# Altium schematic sheet attenuation_stage.SchDoc
size A4; CompanyName: MCI Management Center Innsbruck; Address1: Universitätsstraße 15; Address2: A-6020 Innsbruck
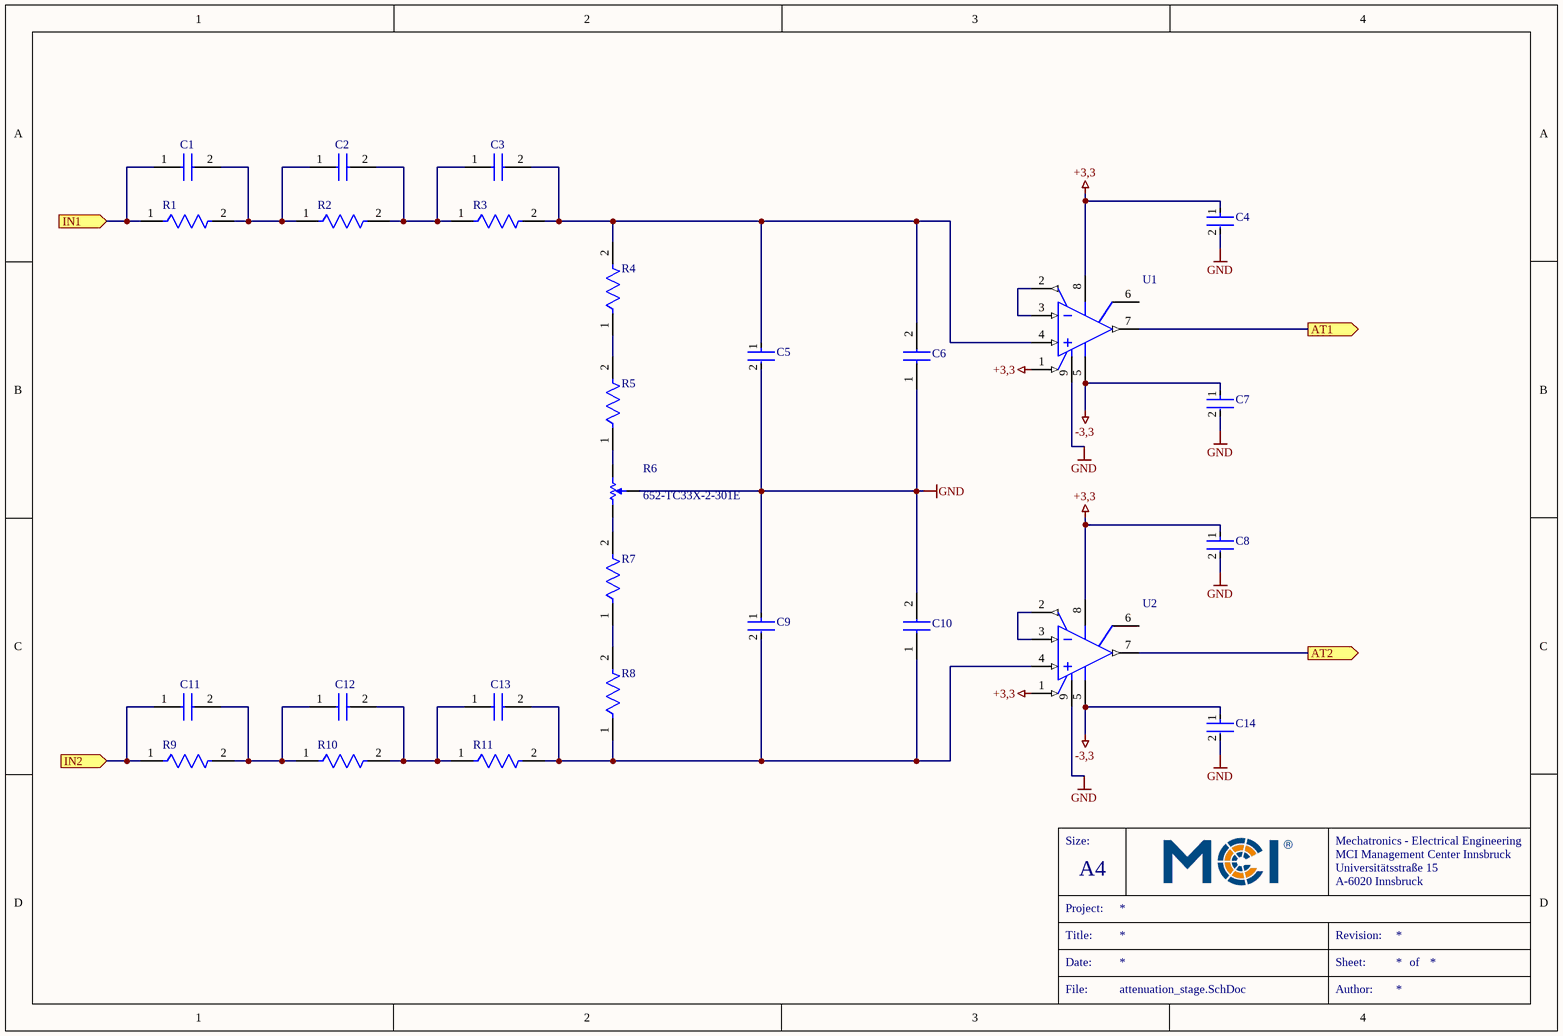
[diagram p0: attenuation_stage.SchDoc]

## Parts
C1  C0402C100C5GACAUTO  [CAPC1005X65N]  (value not drawn)
C2  C0402C100C5GACAUTO  [CAPC1005X65N]  (value not drawn)
C3  C0402C100C5GACAUTO  [CAPC1005X65N]  (value not drawn)
C4  CGA2B3X7R1E104K050BB  [FP-CGA2B-IPC_B]  (value not drawn)
C5  GRT1555C1H511FA02D  [FP-GRT155-0_05-IPC_A]  (value not drawn)
C6  JR200  [CAPM3531X35N]  (value not drawn)
C7  CGA2B3X7R1E104K050BB  [FP-CGA2B-IPC_B]  (value not drawn)
C8  CGA2B3X7R1E104K050BB  [FP-CGA2B-IPC_B]  (value not drawn)
C9  GRT1555C1H511FA02D  [FP-GRT155-0_05-IPC_A]  (value not drawn)
C10  JR200  [CAPM3531X35N]  (value not drawn)
C11  C0402C100C5GACAUTO  [CAPC1005X65N]  (value not drawn)
C12  C0402C100C5GACAUTO  [CAPC1005X65N]  (value not drawn)
C13  C0402C100C5GACAUTO  [CAPC1005X65N]  (value not drawn)
C14  CGA2B3X7R1E104K050BB  [FP-CGA2B-IPC_B]  (value not drawn)
R1  ERA-3AEB334V  [FP-ERA3A-MFG]  (value not drawn)
R2  ERA-3AEB334V  [FP-ERA3A-MFG]  (value not drawn)
R3  ERA-3AEB334V  [FP-ERA3A-MFG]  (value not drawn)
R4  RT0603BRD076K49L  [FP-RT0603-MFG]  (value not drawn)
R5  RT0603BRD0721R5L  [FP-RT0603-MFG]  (value not drawn)
R6  Mouser Part Number: 652-TC33X-2-301E  [BOUR-TC33X-2_V]  (hidden comment: TC33X-2-103E)
R7  RT0603BRD0721R5L  [FP-RT0603-MFG]  (value not drawn)
R8  RT0603BRD076K49L  [FP-RT0603-MFG]  (value not drawn)
R9  ERA-3AEB334V  [FP-ERA3A-MFG]  (value not drawn)
R10  ERA-3AEB334V  [FP-ERA3A-MFG]  (value not drawn)
R11  ERA-3AEB334V  [FP-ERA3A-MFG]  (value not drawn)
U1  ADA4817-1ACPZ-R7  [ADI-CP-8-2_L]  (value not drawn)
U2  ADA4817-1ACPZ-R7  [ADI-CP-8-2_L]  (value not drawn)

## Ports
AT1 (out), AT2 (out), IN1 (in), IN2 (in)

## Nets
+3,3: C4.1 C8.1 U1.1(~{PD}) U1.8(+VS) U2.1(~{PD}) U2.8(+VS)
-3,3: C7.1 C14.1 U1.5(-VS) U2.5(-VS)
GND: C4.2 C5.2 C6.1 C7.2 C8.2 C9.1 C10.2 C14.2 R6.2 U1.9(EP) U2.9(EP)
AT1: U1.7(OUT) ; port AT1
AT2: U2.7(OUT) ; port AT2
IN1: C1.1 R1.1 ; port IN1
IN2: C11.1 R9.1 ; port IN2
NetC1_2: C1.2 C2.1 R1.2 R2.1
NetC2_2: C2.2 C3.1 R2.2 R3.1
NetC3_2: C3.2 C5.1 C6.2 R3.2 R4.2 U1.4(+IN)
NetC9_2: C9.2 C10.1 C13.2 R8.1 R11.2 U2.4(+IN)
NetC11_2: C11.2 C12.1 R9.2 R10.1
NetC12_2: C12.2 C13.1 R10.2 R11.1
NetR4_1: R4.1 R5.2
NetR5_1: R5.1 R6.3
NetR6_1: R6.1 R7.2
NetR7_1: R7.1 R8.2
NetU1_2: U1.2(FB) U1.3(-IN)
NetU2_2: U2.2(FB) U2.3(-IN)

Not connected (* = marked no-connect by the designer): U1 6(NC); U2 6(NC)

## Notes on the sheet
- Size:
- Mechatronics - Electrical Engineering
- Project:
- A4
- Title:
- Date:
- Revision:
- Sheet:
- of
- File:
- Author:

## Library data of the parts
C1-C3 C11-C13 = C0402C100C5GACAUTO: Capacitor; Manufacturer_Name: Yageo Group; Datasheet Link: https://www.arrow.com/en/products/c0402c100c5gacauto/kemet-corporation?region=nac; Height: 0.65mm; Manufacturer_Part_Number: C0402C100C5GACAUTO; Mouser Part Number: 80-C0402C100C5GAUTO; Mouser Price/Stock: https://www.mouser.co.uk/ProductDetail/KEMET/C0402C100C5GACAUTO?qs=jI8Gez59nxIdSgXSmqmKxg%3D%3D; Arrow Part Number: C0402C100C5GACAUTO; Arrow Price/Stock: https://www.arrow.com/en/products/c0402c100c5gacauto/kemet-corporation?region=nac
C4 C7 C8 C14 = CMP-2000-06086-2: Cap Ceramic 100nF 25V X7R 10% Pad SMD 0402 +125°C Automotive T/R; Lead Free: Lead Free; Termination: SMD/SMT; Voltage Rating: 25V; Voltage: 25V; Composition: Ceramic; Case/Package: 0402; Mount: Surface Mount; Voltage Rating (DC): 25V; Tolerance: 10%; Length: 1mm; Width: 0.02inch; REACH SVHC: No SVHC; Max Operating Temperature: 125°C; Case Code (Metric): 1005; Case Code (Imperial): 0402; Package Quantity: 1; Depth: 0.5mm; Min Operating Temperature: -55°C; Thickness: 0.022inch; Capacitance: 100nF; Height: 0.5mm; Dielectric: X7R; Packaging: Tape and Reel; Weight: 2.3E-05oz; Ratings: AEC-Q200
C5 C9 = CMP-06035-032859-1: Multi-Layer Ceramic Capacitor 510pF 50V C0G ±1% 0402 Paper T/R
C6 C10 = JR200: Capacitor; Manufacturer_Name: Knowles; Datasheet Link: https://datasheet.datasheetarchive.com/originals/distributors/DKDS-39/7593.pdf; Height: 0.35mm; Manufacturer_Part_Number: JR200; Mouser Part Number: 768-JR200; Mouser Price/Stock: https://www.mouser.co.uk/ProductDetail/Knowles-Voltronics/JR200?qs=Xqu1B%2Fs4UobrJFNnt%2FmsIw%3D%3D
R1-R3 R9-R11 = CMP-2000-00042-2: NexarPartId: 1240193; Max Power Dissipation: 100mW; Temperature Coefficient: 25ppm/°C; Voltage Rating (DC): 75V; Resistance: 330kΩ; Tolerance: 0.1%; Depth: 800µm; Composition: Metal Film, Thin Film; Termination: SMD/SMT; RoHS: Compliant; Case Code (Metric): 1608; Length: 1.6mm; Features: Automotive AEC-Q200; Number of Terminations: 2; Military Standard: Not; Min Operating Temperature: -55°C; Power Rating: 100mW; REACH SVHC: No SVHC; Mount: Surface Mount; Voltage Rating: 75V; Lifecycle Status: Production; Case/Package: 0603; Case Code (Imperial): 0603; Schedule B: 8533210045, 8533210045; Lead Free: Lead Free; Packaging: Tape & Reel; Radiation Hardening: No; Contact Plating: Tin; Height: 450µm; Max Operating Temperature: 155°C; Width: 800µm; Number of Pins: 2
R4 R8 = CMP-2000-04494-2: RES 6.49K OHM 1/10W .1% SMD 0603; Manufacturer: Yageo; Temperature Coefficient: 25 ppm/°C; Tolerance: 0.001; Value: 6.49KΩ; Power Rating: 0.1W; Voltage Rating: 75V; Device Class L3: Chip SMD Resistors; Mouser Description: Thin Film Resistors - SMD 1/10W 6.49K ohm .1% 25ppm; Ipc Land Pattern Name: RESC16080X45; ComponentLink2URL: http://www.yageo.com/documents/recent/PYu-RT_1-to-0.01_RoHS_L_9.pdf; Device Class L1: Passive Components; Footprint Url: http://www.yageo.com/exep/pages/download/literatures/PYu-R_Mount_10.pdf; Category: Res; Device Class L2: Resistors; Temperature: -55°C to +155°C; Automotive: No; Digikey Description: RES 6.49K OHM 1/10W .1% SMD 0603; Temperature Range High: +155°C; RoHS: TRUE; Manufacturer Part Number: RT0603BRD076K49L; Height: 0.55mm; Package: RT0603; Lead Free: Yes; ComponentLink2Description: Datasheet; Composition: Thin Film; Octopart: https://octopart.com/rt0603brd076k49l-yageo-1437223; Resistance: 6.49KΩ; Temperature Range Low: -55°C; Series: RT
R5 R7 = CMP-03412-004607-1: RES SMD 21.5 OHM 0.1% 1/10W 0603; Manufacturer: Yageo; Temperature Coefficient: 25 ppm/°C; Value: 21.5Ω; Voltage Rating: 75V; Power Rating: 0.1W; Tolerance: 0.001; Temperature Range High: +155°C; Footprint Url: http://www.yageo.com/exep/pages/download/literatures/PYu-R_Mount_10.pdf; Device Class L2: Resistors; Lead Free: Yes; Temperature: -55°C to +155°C; Composition: Thin Film; Manufacturer Part Number: RT0603BRD0721R5L; ComponentLink2Description: Datasheet; Series: RT; Device Class L1: Passive Components; Temperature Range Low: -55°C; Mouser Description: Thin Film Resistors - SMD 1/10W 21.5 ohm .1% 25ppm; Automotive: No; Digikey Description: RES SMD 21.5 OHM 0.1% 1/10W 0603; Package: RT0603; ComponentLink2URL: http://www.yageo.com/documents/recent/PYu-RT_1-to-0.01_RoHS_L_9.pdf; RoHS: TRUE; Resistance: 21.5Ω; Ipc Land Pattern Name: RESC16080X45; Octopart: https://octopart.com/rt0603brd0721r5l-yageo-1419580; Category: Res; Height: 0.55mm; Device Class L3: Chip SMD Resistors
R6 = CMP-2100-03695-1: Trimming Potentiometer, 10000 Ohm, -40 to 100 degC, 3-Pin SMD, RoHS, Tape and Reel; Manufacturer: Bourns; Tolerance: 25%; Max Power Dissipation: 100mW; Number of Turns: 1; Resistance: 10KOhm; Temperature Coefficient: 250ppm/degreesC; Voltage Rating (DC): 50V; Datasheet URL: http://www.bourns.com/docs/Product-Datasheets/TC33.pdf; Composition: Potentiometer; Package Description: 3-Pin Surface Mount Device, Body 3.8 x 3.6 mm; Weight: 29.4mg; Power Rating: 100mW; Termination: FootPrint; Manufacturer URL: http://www.bourns.com/; Width: 0.118inch; Height: 0.047inch; Military Standard: Not; Radiation Hardening: No; Colour: Silver; Case/Package: SMD/SMT; Depth: 3.8mm; Min Operating Temperature: -40degC; Lead Free: LeadFree; Datasheet Version: 42583.0; REACH SVHC: NoSVHC; Length: 3mm; RoHSCompliant: true; Contact Plating: Silver; Taper: Linear; Packaging: TapeandReel; Mount: SurfaceMount; Max Operating Temperature: 100degC; Package Reference: TC33X-2; Package Quantity: 2500; Mouser Nr: 652-TC33X-2-301E
U1 U2 = CMP-0384-00096-1: Single Channel Low Noise Operational Amplifier, 1.05 GHz BW, 870 V/us SR, Industrial, 8-pin QFN (CP-8-2), Reel; Manufacturer: Analog Devices; Iq/Amp: 21mA; Input Bias Current: 2pA; Amplifiers Per Package: 1; V Span Max: 10V; Input Offset Voltage: 2mV; V Span Min: 5V; DatasheetVersion: Rev. A; ComponentLink2URL: http://www.analog.com/static/imported-files/data_sheets/ADA4817-1_4817-2.pdf; ComponentLink1Description: Manufacturer URL; ComponentLink1URL: http://www.analog.com/en/index.html; PartNumber: ADA4817-1ACPZ-R7; PackageVersion: 061507-B; ComponentLink3URL: http://www.analog.com/static/imported-files/packages/56953322593982CP_8_2.pdf; Slew Rate: 870V/us; ComponentLink2Description: Datasheet; Generic Part Number: ADA4817-1; PackageReference: CP-8-2; Small Signal Bandwidth: 1.05GHz; Mounting Technology: Surface Mount; ComponentLink3Description: Package Specification; PackageDescription: 8-Pin Lead Frame Chip Scale Package, Body 3 x 3 mm, Pitch 0.5 mm